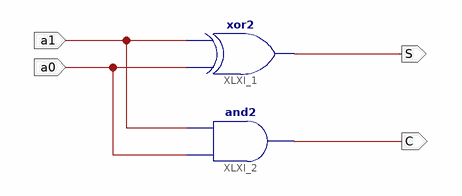
[diagram p0: schematic sheet 1]
// Xilinx ISE schematic half_adder.sch (spartan3) as structural Verilog: 2 symbols, 4 ports
module half_adder (
  input  a0,
  input  a1,
  output C,
  output S
);

  and XLXI_2 (C, a0, a1);
  xor XLXI_1 (S, a0, a1);
endmodule
